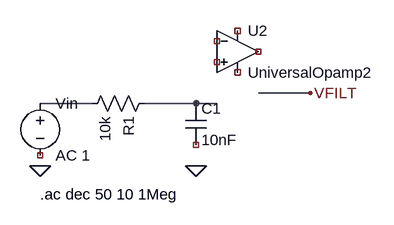
[diagram p0: schematic ltspice_opamp_biquad.asc]
ltspice_opamp_biquad.asc, the LTspice schematic file:
Version 4
SHEET 1 960 640
WIRE 96 160 176 160
WIRE 256 160 336 160
WIRE 336 160 368 160
WIRE 432 144 512 144
FLAG 96 256 0
FLAG 336 256 0
FLAG 512 144 VFILT
SYMBOL voltage 96 144 R0
SYMATTR InstName Vin
SYMATTR Value AC 1
SYMBOL res 272 144 R90
SYMATTR InstName R1
SYMATTR Value 10k
SYMBOL cap 320 160 R0
SYMATTR InstName C1
SYMATTR Value 10nF
SYMBOL OpAmps\UniversalOpamp2 400 80 R0
SYMATTR InstName U2
SYMATTR Value UniversalOpamp2
TEXT 96 300 Left 2 !.ac dec 50 10 1Meg

The netlist it stands for:
* ltspice_opamp_biquad.asc
Vin N001 NC_01 AC 1
R1 N002 N001 10k
C1 N002 NC_02 10nF
XU2 NC_03 NC_04 NC_05 NC_06 NC_07 level.2 UniversalOpamp2 Avol=1Meg GBW=10Meg Slew=10Meg ilimit=25m rail=0 Vos=0 phimargin=45 en=0 enk=0 in=0 ink=0 Rin=500Meg  ; pins IN+ IN- V+ V- OUT
.ac dec 50 10 1Meg
.lib UniversalOpamps2.sub
.backanno
.end